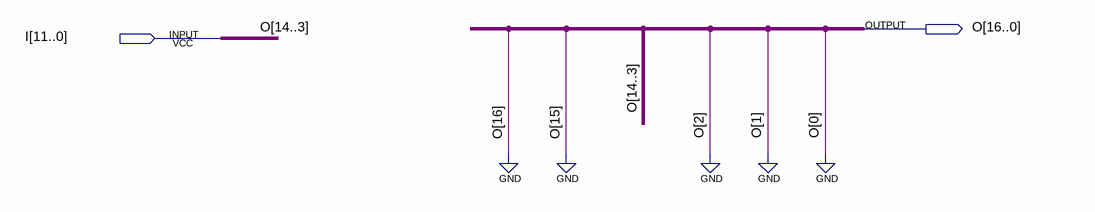
[diagram p0: schematic sheet]
// Quartus schematic mult3.bdf as structural Verilog: 0 symbols, 2 pins
module mult3 (
  input  [11:0] I,
  output [16:0] O
);


  assign O = {2'b00, I, 3'b000};
endmodule
